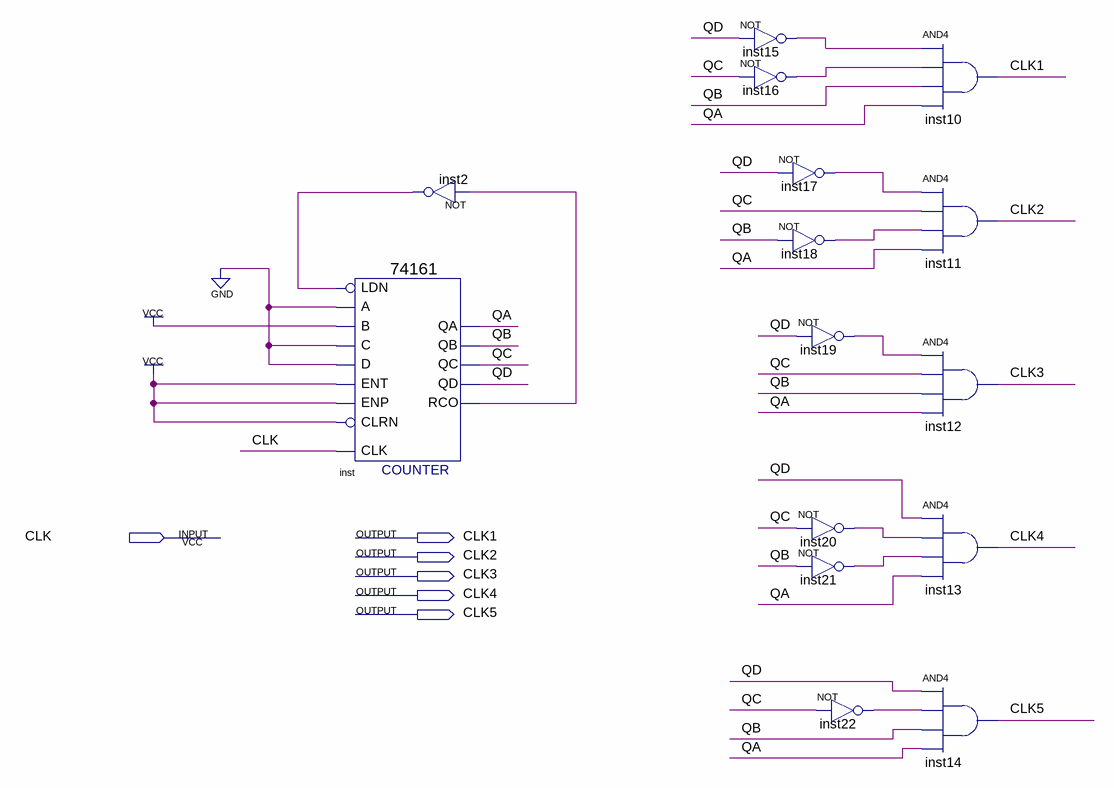
[diagram p0: schematic sheet]
// Quartus schematic CLK_EXTEND.bdf as structural Verilog: 15 symbols, 6 pins
module CLK_EXTEND (
  input  CLK,
  output CLK1,
  output CLK2,
  output CLK3,
  output CLK4,
  output CLK5
);

  wire inst2_out, inst15_out, inst16_out, inst17_out, inst18_out, inst19_out, inst20_out, inst21_out,
       inst22_out, inst_rco, QA, QB, QC, QD;

  \74161  inst (
    .CLRN(1'b1), .CLK(CLK), .ENP(1'b1), .LDN(inst2_out), .A(1'b0), .D(1'b0), .ENT(1'b1), .B(1'b1), .C(1'b0),
    .QD(QD), .QC(QC), .QB(QB), .QA(QA), .RCO(inst_rco));
  not inst2 (inst2_out, inst_rco);
  not inst15 (inst15_out, QD);
  not inst16 (inst16_out, QC);
  not inst17 (inst17_out, QD);
  not inst18 (inst18_out, QB);
  not inst19 (inst19_out, QD);
  not inst20 (inst20_out, QC);
  not inst21 (inst21_out, QB);
  not inst22 (inst22_out, QC);
  and inst10 (CLK1, inst15_out, inst16_out, QB, QA);
  and inst11 (CLK2, inst17_out, QC, inst18_out, QA);
  and inst12 (CLK3, inst19_out, QC, QB, QA);
  and inst13 (CLK4, QD, inst20_out, inst21_out, QA);
  and inst14 (CLK5, QD, inst22_out, QB, QA);
endmodule
